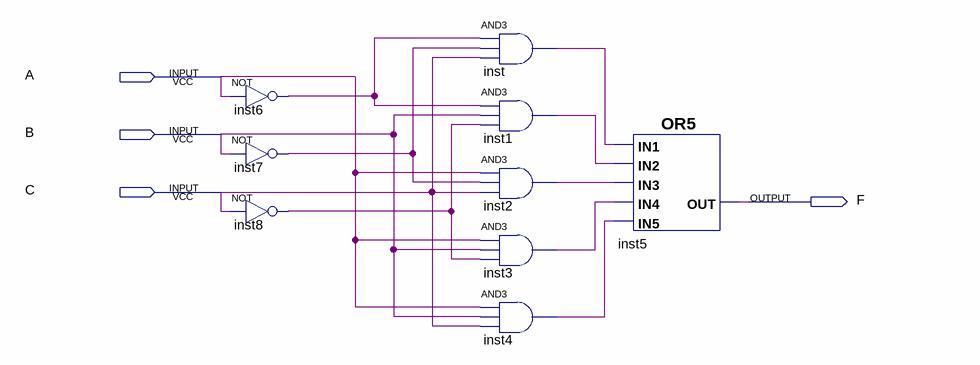
[diagram p0: schematic sheet]
// Quartus schematic sop_block.bdf as structural Verilog: 9 symbols, 4 pins
module sop_block (
  input  A,
  input  B,
  input  C,
  output F
);

  wire inst1_out, inst2_out, inst3_out, inst4_out, inst6_out, inst7_out, inst8_out, inst_out;

  not inst6 (inst6_out, A);
  not inst7 (inst7_out, B);
  not inst8 (inst8_out, C);
  and inst (inst_out, inst6_out, inst7_out, C);
  and inst1 (inst1_out, inst6_out, B, inst8_out);
  and inst2 (inst2_out, A, inst7_out, C);
  and inst3 (inst3_out, A, B, inst8_out);
  and inst4 (inst4_out, A, B, C);
  or inst5 (F, inst_out, inst1_out, inst2_out, inst3_out, inst4_out);
endmodule
